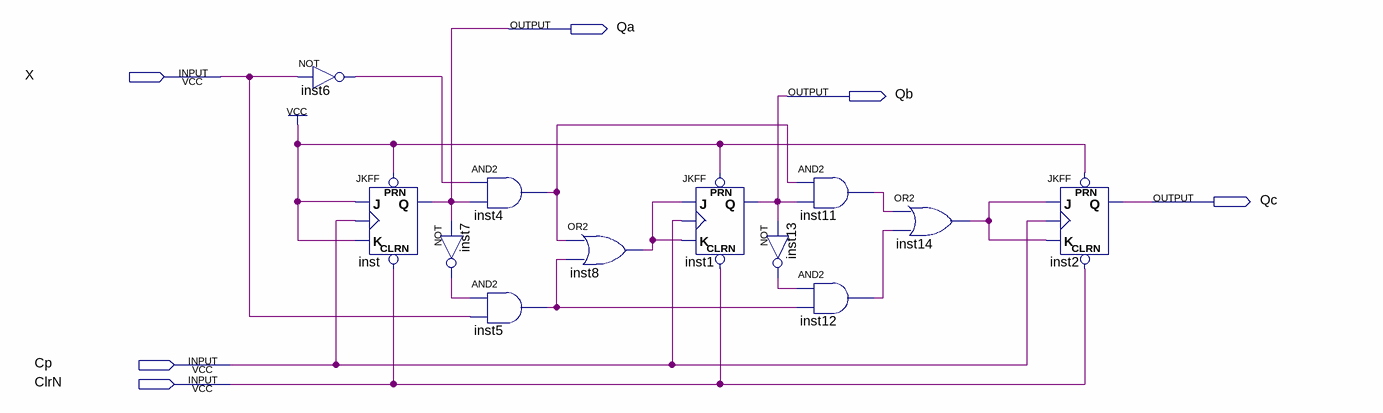
[diagram p0: schematic sheet]
// Quartus schematic 3bits_updown_counter.bdf as structural Verilog: 12 symbols, 6 pins
module \3bits_updown_counter  (
  input  X,
  input  Cp,
  input  ClrN,
  output Qa,
  output Qb,
  output Qc
);

  wire inst4_out, inst5_out, inst6_out, inst7_out, inst8_out, inst11_out, inst12_out, inst13_out, inst14_out;

  not inst6 (inst6_out, X);
  JKFF inst (.PRN(1'b1), .CLRN(ClrN), .K(1'b1), .J(1'b1), .CLK(Cp), .Q(Qa));
  and inst4 (inst4_out, inst6_out, Qa);
  not inst7 (inst7_out, Qa);
  and inst5 (inst5_out, inst7_out, X);
  or inst8 (inst8_out, inst4_out, inst5_out);
  JKFF inst1 (.PRN(1'b1), .CLRN(ClrN), .K(inst8_out), .J(inst8_out), .CLK(Cp), .Q(Qb));
  not inst13 (inst13_out, Qb);
  and inst11 (inst11_out, inst4_out, Qb);
  and inst12 (inst12_out, inst13_out, inst5_out);
  or inst14 (inst14_out, inst11_out, inst12_out);
  JKFF inst2 (.PRN(1'b1), .CLRN(ClrN), .K(inst14_out), .J(inst14_out), .CLK(Cp), .Q(Qc));
endmodule
